# Altium schematic sheet JESD204_B_or_C.SchDoc: JESD204_B
size A3; Organization: Altium Limited; Address1: L3, 12a Rodborough Rd; Address2: Frenchs Forest; Address3: NSW; Address4: Australia 2086
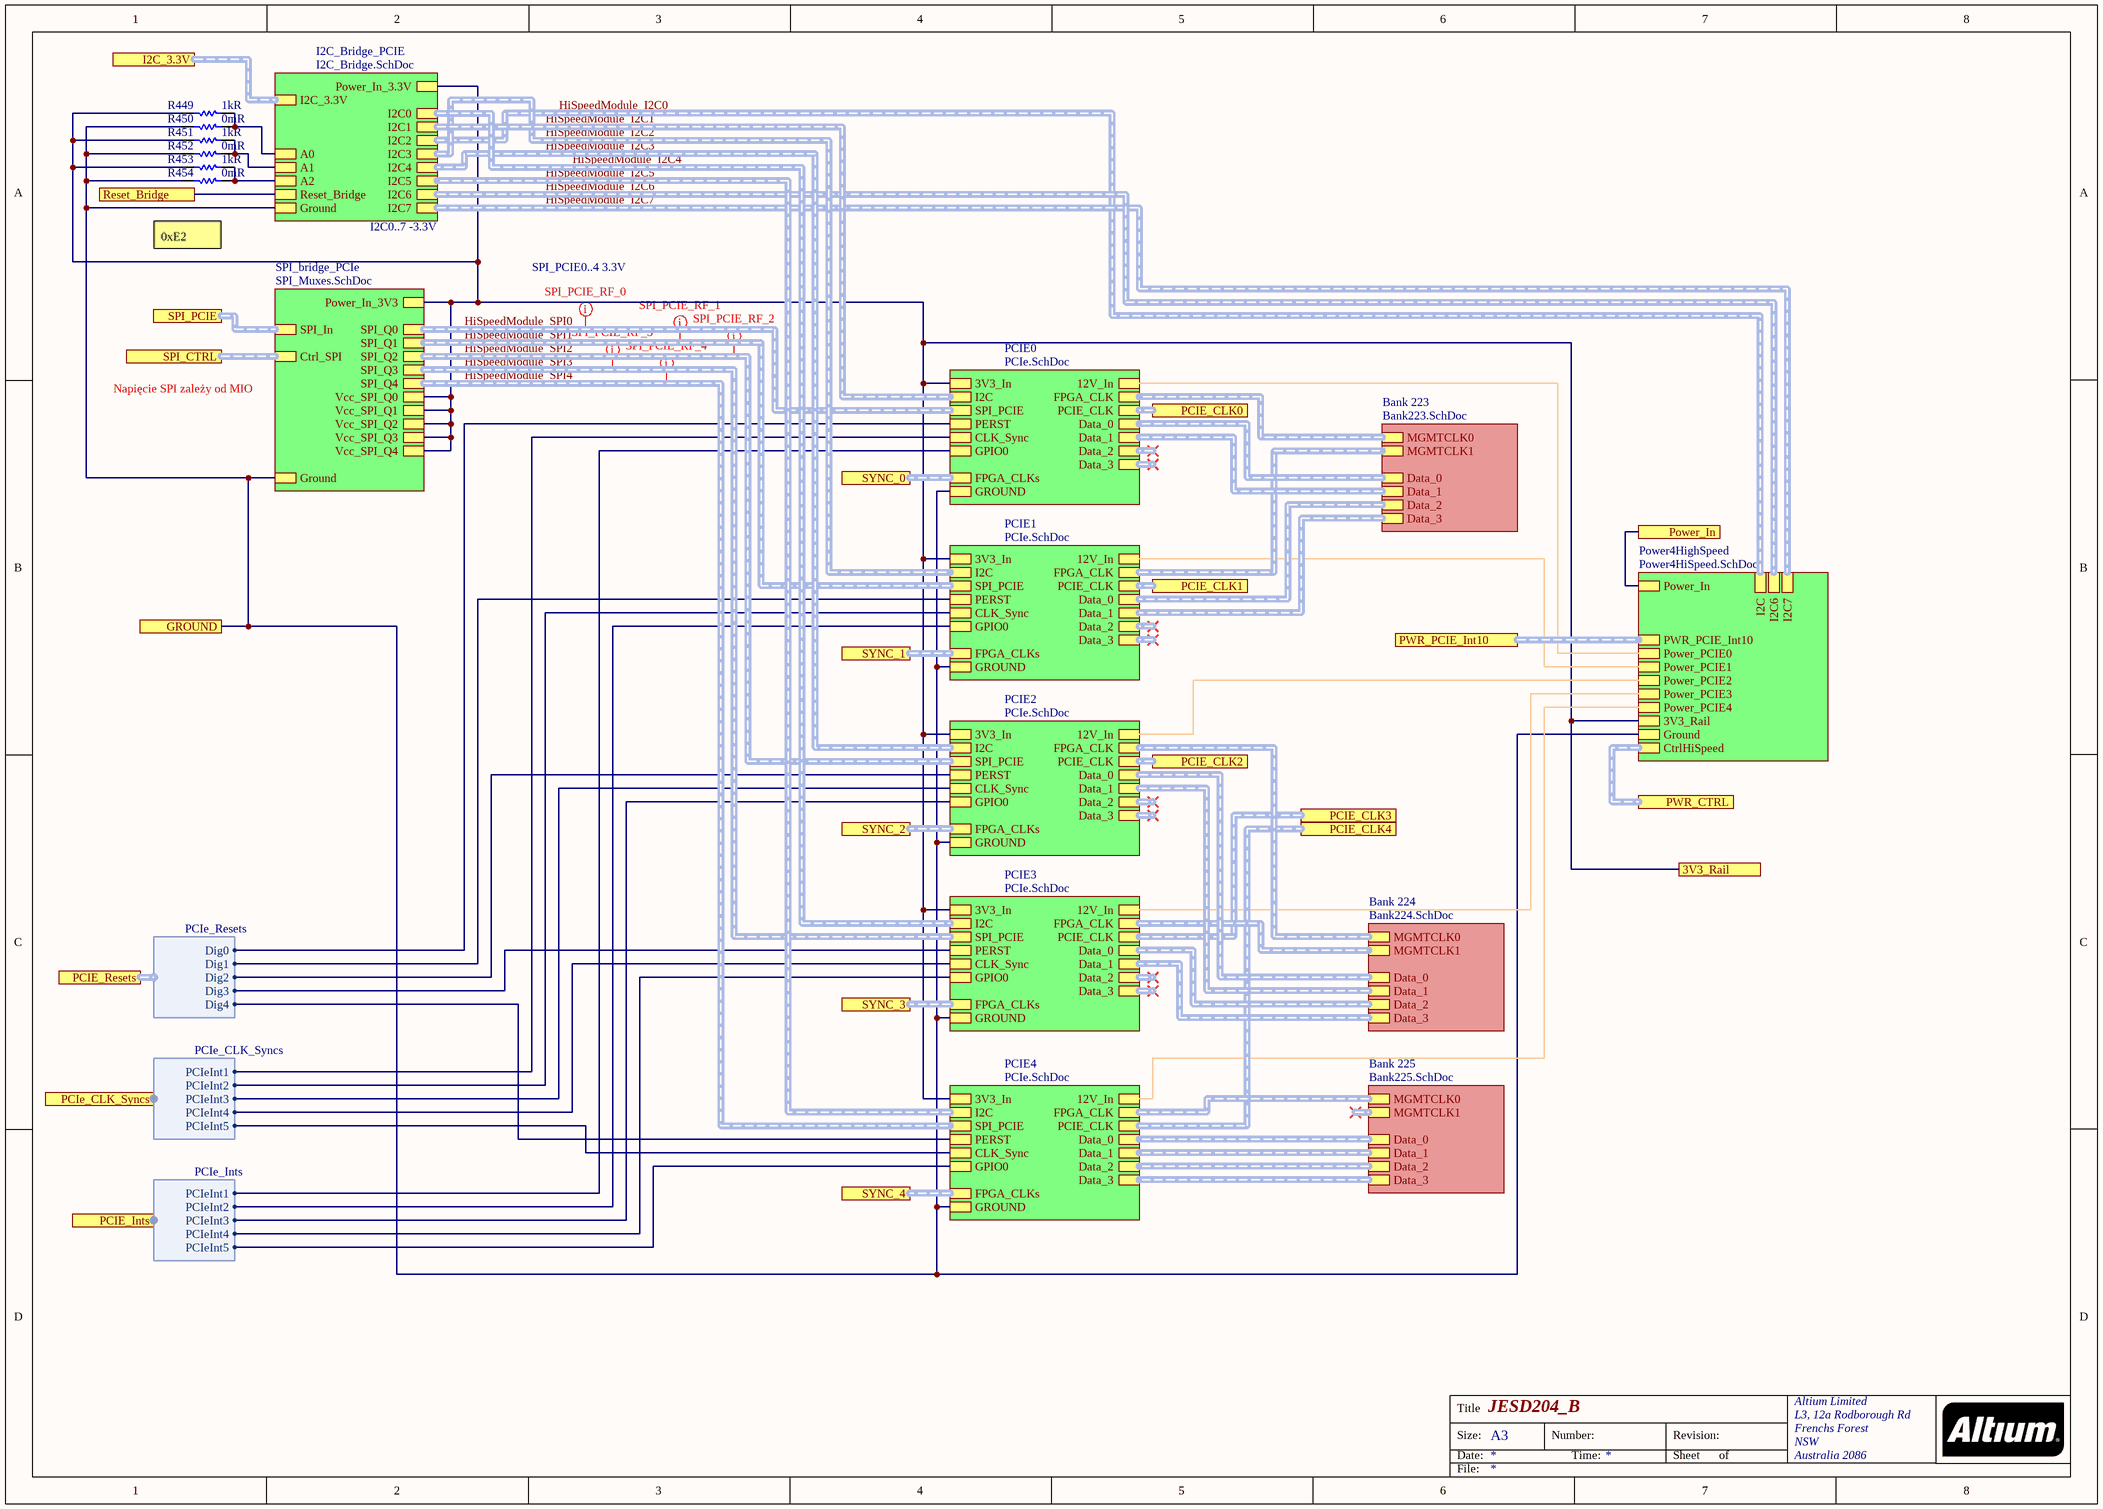
[diagram p0: JESD204_B_or_C.SchDoc]

## Parts
R449  1kR  [RES 0402/1005 RF KK]
R450  0mR  [RES 0402/1005 RF KK]
R451  1kR  [RES 0402/1005 RF KK]
R452  0mR  [RES 0402/1005 RF KK]
R453  1kR  [RES 0402/1005 RF KK]
R454  0mR  [RES 0402/1005 RF KK]

## Sub-sheets
Bank 223 = Bank223.SchDoc: MGMTCLK0 (harness Diff_1Pair), MGMTCLK1 (harness Diff_1Pair), Data_3 (harness Diff_2PairData), Data_2 (harness Diff_2PairData), Data_1 (harness Diff_2PairData), Data_0 (harness Diff_2PairData)
Bank 224 = Bank224.SchDoc: MGMTCLK0 (harness Diff_1Pair), MGMTCLK1 (harness Diff_1Pair), Data_3 (harness Diff_2PairData), Data_2 (harness Diff_2PairData), Data_1 (harness Diff_2PairData), Data_0 (harness Diff_2PairData)
Bank 225 = Bank225.SchDoc: Data_3 (harness Diff_2PairData), MGMTCLK0 (harness Diff_1Pair), Data_2 (harness Diff_2PairData), Data_1 (harness Diff_2PairData), Data_0 (harness Diff_2PairData), MGMTCLK1 (harness Diff_1Pair)
I2C_Bridge_PCIE = I2C_Bridge.SchDoc: I2C0 (harness I2C), I2C1 (harness I2C), I2C2 (harness I2C), I2C3 (harness I2C), I2C4 (harness I2C), I2C5 (harness I2C), I2C6 (harness I2C), I2C7 (harness I2C), Ground, A2, A1, A0, I2C_3.3V (harness I2C), Reset_Bridge, Power_In_3.3V
PCIE0 = PCIe.SchDoc: 12V_In, I2C (harness I2C), PERST, Data_0 (harness Diff_2PairData), Data_1 (harness Diff_2PairData), Data_2 (harness Diff_2PairData), Data_3 (harness Diff_2PairData), SPI_PCIE (harness SPI_H), 3V3_In, GROUND, FPGA_CLKs (harness Diff_3Diff_Pcie), PCIE_CLK (harness Diff_1Pair), CLK_Sync, GPIO0, FPGA_CLK (harness Diff_1Pair)
PCIE1 = PCIe.SchDoc: 12V_In, I2C (harness I2C), PCIE_CLK (harness Diff_1Pair), PERST, Data_0 (harness Diff_2PairData), Data_1 (harness Diff_2PairData), Data_2 (harness Diff_2PairData), Data_3 (harness Diff_2PairData), SPI_PCIE (harness SPI_H), 3V3_In, GROUND, FPGA_CLKs (harness Diff_3Diff_Pcie), CLK_Sync, GPIO0, FPGA_CLK (harness Diff_1Pair)
PCIE2 = PCIe.SchDoc: 12V_In, I2C (harness I2C), PCIE_CLK (harness Diff_1Pair), PERST, Data_0 (harness Diff_2PairData), Data_1 (harness Diff_2PairData), Data_2 (harness Diff_2PairData), Data_3 (harness Diff_2PairData), SPI_PCIE (harness SPI_H), 3V3_In, GROUND, FPGA_CLKs (harness Diff_3Diff_Pcie), CLK_Sync, GPIO0, FPGA_CLK (harness Diff_1Pair)
PCIE3 = PCIe.SchDoc: 12V_In, I2C (harness I2C), PCIE_CLK (harness Diff_1Pair), PERST, Data_0 (harness Diff_2PairData), Data_1 (harness Diff_2PairData), Data_2 (harness Diff_2PairData), Data_3 (harness Diff_2PairData), SPI_PCIE (harness SPI_H), 3V3_In, GROUND, FPGA_CLKs (harness Diff_3Diff_Pcie), CLK_Sync, GPIO0, FPGA_CLK (harness Diff_1Pair)
PCIE4 = PCIe.SchDoc: 12V_In, I2C (harness I2C), PCIE_CLK (harness Diff_1Pair), PERST, Data_0 (harness Diff_2PairData), Data_1 (harness Diff_2PairData), Data_2 (harness Diff_2PairData), Data_3 (harness Diff_2PairData), SPI_PCIE (harness SPI_H), 3V3_In, FPGA_CLKs (harness Diff_3Diff_Pcie), GROUND, CLK_Sync, GPIO0, FPGA_CLK (harness Diff_1Pair)
Power4HighSpeed = Power4HiSpeed.SchDoc: Power_In, Power_PCIE0, Power_PCIE1, Power_PCIE2, Power_PCIE3, Power_PCIE4, CtrlHiSpeed (harness Ctrl_Pwr4HiSpeed), Ground, I2C (harness I2C), 3V3_Rail, PWR_PCIE_Int10 (harness PWR_PCIE_Int10), I2C6, I2C7
SPI_bridge_PCIe = SPI_Muxes.SchDoc: SPI_Q0 (harness SPI_H), SPI_Q1 (harness SPI_H), SPI_Q2 (harness SPI_H), SPI_Q3 (harness SPI_H), SPI_Q4 (harness SPI_H), SPI_In (harness SPI_H), Power_In_3V3, Ctrl_SPI (harness Ctrl_SPI_PCIE), Vcc_SPI_Q4, Vcc_SPI_Q3, Vcc_SPI_Q2, Vcc_SPI_Q1, Vcc_SPI_Q0, Ground

## Ports
3V3_Rail, GROUND, I2C_3.3V (harness I2C), PCIE_CLK0 (harness Diff_1Pair), PCIE_CLK1 (harness Diff_1Pair), PCIE_CLK2 (harness Diff_1Pair), PCIE_CLK3 (harness Diff_1Pair), PCIE_CLK4 (harness Diff_1Pair), PCIe_CLK_Syncs (harness PCIe_CLK_Syncs), PCIE_Ints (harness PCIe_Ints), PCIE_Resets (harness PCIe_Resets), Power_In, PWR_CTRL (harness Ctrl_Pwr4HiSpeed), PWR_PCIE_Int10 (harness PWR_PCIE_Int10), Reset_Bridge, SPI_CTRL (harness Ctrl_SPI_PCIE), SPI_PCIE (harness SPI_H), SYNC_0 (harness Diff_3Diff_Pcie), SYNC_1 (harness Diff_3Diff_Pcie), SYNC_2 (harness Diff_3Diff_Pcie), SYNC_3 (harness Diff_3Diff_Pcie), SYNC_4 (harness Diff_3Diff_Pcie)

## Harnesses
PCIe_Resets: Dig0, Dig1, Dig2, Dig3, Dig4
PCIe_CLK_Syncs: PCIeInt1, PCIeInt2, PCIeInt3, PCIeInt4, PCIeInt5
PCIe_Ints: PCIeInt1, PCIeInt2, PCIeInt3, PCIeInt4, PCIeInt5

## Nets
3V3_Rail: R449.1 R451.1 R453.1 ; port 3V3_Rail, sheet PCIE0/3V3_In, sheet PCIE1/3V3_In, sheet PCIE2/3V3_In, sheet PCIE3/3V3_In, sheet PCIE4/3V3_In, sheet I2C_Bridge_PCIE/Power_In_3.3V, sheet SPI_bridge_PCIe/Power_In_3V3, sheet SPI_bridge_PCIe/Vcc_SPI_Q4, sheet SPI_bridge_PCIe/Vcc_SPI_Q3, sheet SPI_bridge_PCIe/Vcc_SPI_Q2, sheet SPI_bridge_PCIe/Vcc_SPI_Q1, sheet SPI_bridge_PCIe/Vcc_SPI_Q0, sheet Power4HighSpeed/3V3_Rail
GROUND: R450.2 R452.2 R454.2 ; port GROUND, sheet PCIE0/GROUND, sheet PCIE1/GROUND, sheet PCIE2/GROUND, sheet PCIE3/GROUND, sheet PCIE4/GROUND, sheet I2C_Bridge_PCIE/Ground, sheet SPI_bridge_PCIe/Ground, sheet Power4HighSpeed/Ground
Power_In: port Power_In, sheet Power4HighSpeed/Power_In
Reset_Bridge: port Reset_Bridge, sheet I2C_Bridge_PCIE/Reset_Bridge
NetR449_2: R449.2 R450.1 ; sheet I2C_Bridge_PCIE/A0
NetR451_2: R451.2 R452.1 ; sheet I2C_Bridge_PCIE/A1
NetR453_2: R453.2 R454.1 ; sheet I2C_Bridge_PCIE/A2
(unnamed): sheet PCIE0/12V_In, sheet Power4HighSpeed/Power_PCIE0
(unnamed): sheet PCIE0/PERST, port PCIE_Resets.Dig0
(unnamed): sheet PCIE0/CLK_Sync, port PCIe_CLK_Syncs.PCIeInt1
(unnamed): sheet PCIE0/GPIO0, port PCIE_Ints.PCIeInt1
(unnamed): sheet PCIE1/12V_In, sheet Power4HighSpeed/Power_PCIE1
(unnamed): sheet PCIE1/PERST, port PCIE_Resets.Dig1
(unnamed): sheet PCIE1/CLK_Sync, port PCIe_CLK_Syncs.PCIeInt2
(unnamed): sheet PCIE1/GPIO0, port PCIE_Ints.PCIeInt2
(unnamed): sheet PCIE2/12V_In, sheet Power4HighSpeed/Power_PCIE2
(unnamed): sheet PCIE2/PERST, port PCIE_Resets.Dig2
(unnamed): sheet PCIE2/CLK_Sync, port PCIe_CLK_Syncs.PCIeInt3
(unnamed): sheet PCIE2/GPIO0, port PCIE_Ints.PCIeInt3
(unnamed): sheet PCIE3/12V_In, sheet Power4HighSpeed/Power_PCIE3
(unnamed): sheet PCIE3/PERST, port PCIE_Resets.Dig3
(unnamed): sheet PCIE3/CLK_Sync, port PCIe_CLK_Syncs.PCIeInt4
(unnamed): sheet PCIE3/GPIO0, port PCIE_Ints.PCIeInt4
(unnamed): sheet PCIE4/12V_In, sheet Power4HighSpeed/Power_PCIE4
(unnamed): sheet PCIE4/PERST, port PCIE_Resets.Dig4
(unnamed): sheet PCIE4/CLK_Sync, port PCIe_CLK_Syncs.PCIeInt5
(unnamed): sheet PCIE4/GPIO0, port PCIE_Ints.PCIeInt5

## Buses and harness runs
harness HiSpeedModule_I2C0 = sheet I2C_Bridge_PCIE/I2C2 = sheet Power4HighSpeed/I2C
harness HiSpeedModule_I2C1 = sheet I2C_Bridge_PCIE/I2C1 = sheet PCIE0/I2C
harness HiSpeedModule_I2C2 = sheet I2C_Bridge_PCIE/I2C3 = sheet PCIE1/I2C
harness HiSpeedModule_I2C3 = sheet I2C_Bridge_PCIE/I2C4 = sheet PCIE2/I2C
harness HiSpeedModule_I2C4 = sheet I2C_Bridge_PCIE/I2C0 = sheet PCIE3/I2C
harness HiSpeedModule_I2C5 = sheet I2C_Bridge_PCIE/I2C5 = sheet PCIE4/I2C
harness HiSpeedModule_I2C6 = sheet I2C_Bridge_PCIE/I2C6 = sheet Power4HighSpeed/I2C6
harness HiSpeedModule_I2C7 = sheet I2C_Bridge_PCIE/I2C7 = sheet Power4HighSpeed/I2C7
harness HiSpeedModule_SPI0 = sheet PCIE0/SPI_PCIE = sheet SPI_bridge_PCIe/SPI_Q0
harness HiSpeedModule_SPI1 = sheet PCIE1/SPI_PCIE = sheet SPI_bridge_PCIe/SPI_Q1
harness HiSpeedModule_SPI2 = sheet PCIE2/SPI_PCIE = sheet SPI_bridge_PCIe/SPI_Q2
harness HiSpeedModule_SPI3 = sheet PCIE3/SPI_PCIE = sheet SPI_bridge_PCIe/SPI_Q3
harness HiSpeedModule_SPI4 = sheet PCIE4/SPI_PCIE = sheet SPI_bridge_PCIe/SPI_Q4
harness port I2C_3.3V = sheet I2C_Bridge_PCIE/I2C_3.3V
harness port PCIE_CLK0 = sheet PCIE0/PCIE_CLK
harness port PCIE_CLK1 = sheet PCIE1/PCIE_CLK
harness port PCIE_CLK2 = sheet PCIE2/PCIE_CLK
harness port PCIE_CLK3 = sheet PCIE3/PCIE_CLK
harness port PCIE_CLK4 = sheet PCIE4/PCIE_CLK
harness port PWR_CTRL = sheet Power4HighSpeed/CtrlHiSpeed
harness port PWR_PCIE_Int10 = sheet Power4HighSpeed/PWR_PCIE_Int10
harness port SPI_CTRL = sheet SPI_bridge_PCIe/Ctrl_SPI
harness port SPI_PCIE = sheet SPI_bridge_PCIe/SPI_In
harness port SYNC_0 = sheet PCIE0/FPGA_CLKs
harness port SYNC_1 = sheet PCIE1/FPGA_CLKs
harness port SYNC_2 = sheet PCIE2/FPGA_CLKs
harness port SYNC_3 = sheet PCIE3/FPGA_CLKs
harness port SYNC_4 = sheet PCIE4/FPGA_CLKs
harness sheet Bank 223/Data_0 = sheet PCIE0/Data_0
harness sheet Bank 223/Data_1 = sheet PCIE0/Data_1
harness sheet Bank 223/Data_2 = sheet PCIE1/Data_0
harness sheet Bank 223/Data_3 = sheet PCIE1/Data_1
harness sheet Bank 223/MGMTCLK0 = sheet PCIE0/FPGA_CLK
harness sheet Bank 223/MGMTCLK1 = sheet PCIE1/FPGA_CLK
harness sheet Bank 224/Data_0 = sheet PCIE2/Data_0
harness sheet Bank 224/Data_1 = sheet PCIE2/Data_1
harness sheet Bank 224/Data_2 = sheet PCIE3/Data_0
harness sheet Bank 224/Data_3 = sheet PCIE3/Data_1
harness sheet Bank 224/MGMTCLK0 = sheet PCIE2/FPGA_CLK
harness sheet Bank 224/MGMTCLK1 = sheet PCIE3/FPGA_CLK
harness sheet Bank 225/Data_0 = sheet PCIE4/Data_0
harness sheet Bank 225/Data_1 = sheet PCIE4/Data_1
harness sheet Bank 225/Data_2 = sheet PCIE4/Data_2
harness sheet Bank 225/Data_3 = sheet PCIE4/Data_3
harness sheet Bank 225/MGMTCLK0 = sheet PCIE4/FPGA_CLK

## Layout directives
net class SPI_PCIE_RF_0: (no net found under the mark)
net class SPI_PCIE_RF_1: (no net found under the mark)
net class SPI_PCIE_RF_2: (no net found under the mark)
net class SPI_PCIE_RF_3: (no net found under the mark)
net class SPI_PCIE_RF_4: (no net found under the mark)

## Notes on the sheet
- 0xE2
- I2C0..7 -3.3V
- SPI_PCIE0..4 3.3V
- Napięcie SPI zależy od MIO
- Title
- Size:
- Date:
- A3
- Number:
- Time:
- Revision:
- Sheet
- of
- File:

## Library data of the parts
R449 R451 R453 = Resistor: PANASONIC - ERJ-2RKF1001X - SMD Chip Resistor, 0402 [1005 Metric], 1 kohm, ERJ2R Series, 50 V, Thick Film, 100 mW; Temperature Coefficient: 100ppm/°C; Tolerance: 1%; Voltage Rating (DC): 50V; Power Rating: 100mW; Supplier 1: Digi-Key; Supplier Part Number 1: P1.00KLDKR-ND; Manufacturer: Panasonic; Manufacturer Part Number: ERJ-2RKF1001X; RoHS: Yes; Category: Chip SMD Resistors; Stock 1: 1864188; Pricing 1: 1=0,10000, 10=0,04300, 100=0,01740, 1000=0,00782, 2500=0,00678, 5000=0,00561 (USD); Mount: Surface Mount; Case/Package: 0402; Number of Pins: 2; Contact Plating: Tin; Case Code (Imperial): 0402; Case Code (Metric): 1005; Min Operating Temperature: -55°C; Max Operating Temperature: 155°C; Composition: Thick Film; Resistance: 1kR; Termination: SMD/SMT; Number of Terminations: 2; Military Standard: Not; Features: Automotive AEC-Q200; Packaging: Tape and Reel; Voltage Rating: 50V; Package Quantity: 1; Max Power Dissipation: 100mW; Working Voltage: 50V; Length: 1mm; Height: 0.35mm; Depth: 0.5mm; Width: 0.5mm; Radiation Hardening: No; Lead Free: Lead Free; REACH SVHC: No SVHC; ComponentLink1URL: https://datasheet.ciiva.com/11821/0900766b80f80784-11821203.pdf?src-supplier=RSComponents; ComponentLink1Description: https://datasheet.ciiva.com/11821/0900766b80f80784-11821203.pdf?src-supplier=RSComponents; ComponentLink2URL: https://datasheet.ciiva.com/7942/aoa0000ce2-7942426.pdf?src-supplier=Element14; ComponentLink2Description: https://datasheet.ciiva.com/7942/aoa0000ce2-7942426.pdf?src-supplier=Element14; ComponentLink3URL: https://datasheet.ciiva.com/16523/aoa0000ce2-16523834.pdf?src-supplier=Avnet+Asia; ComponentLink3Description: https://datasheet.ciiva.com/16523/aoa0000ce2-16523834.pdf?src-supplier=Avnet+Asia; ComponentLink4URL: https://datasheet.ciiva.com/17215/aoa0000ce2-17215308.pdf?src-supplier=Avnet+Europe; ComponentLink4Description: https://datasheet.ciiva.com/17215/aoa0000ce2-17215308.pdf?src-supplier=Avnet+Europe; ComponentLink5URL: https://datasheet.ciiva.com/22673/1678782-22673916.pdf?src-supplier=Element14; ComponentLink5Description: https://datasheet.ciiva.com/22673/1678782-22673916.pdf?src-supplier=Element14; ComponentLink6URL: https://datasheet.ciiva.com/28532/1678782-28532109.pdf?src-supplier=Element14; ComponentLink6Description: https://datasheet.ciiva.com/28532/1678782-28532109.pdf?src-supplier=Element14; ComponentLink7URL: https://datasheet.ciiva.com/16767/70260748-16767559.pdf?src-supplier=Allied+Electronics; ComponentLink7Description: https://datasheet.ciiva.com/16767/70260748-16767559.pdf?src-supplier=Allied+Electronics; ComponentLink8URL: https://datasheet.ciiva.com/9198/aoa0000ce2-9198920.pdf?src-supplier=Avnet; ComponentLink8Description: https://datasheet.ciiva.com/9198/aoa0000ce2-9198920.pdf?src-supplier=Avnet; ComponentLink9URL: https://datasheet.ciiva.com/16771/70260748-16771979.pdf?src-supplier=Allied+Electronics; ComponentLink9Description: https://datasheet.ciiva.com/16771/70260748-16771979.pdf?src-supplier=Allied+Electronics
R450 R452 R454 = Resistor: Manufacturer 1: Yageo; Manufacturer Part Number 1: RC0402JR-070RL; Power Rating: 62.5mW; Tolerance: 5%; Voltage Rating: 50V; Max Power Dissipation: 63mW; Temperature Coefficient: 200ppm/°C; Supplier 1: Digi-Key; Supplier Part Number 1: 311-0.0JRCT-ND; Stock 1: 69822252; Pricing 1: 1=0.10000, 10=0.01200, 25=0.00920, 50=0.00680, 100=0.00510, 250=0.00388, 500=0.00308, 1000=0.00227, 5000=0.00163 (USD); RoHS: Yes; Case/Package: 0402; Contact Plating: Tin,Matte; Case Code (Metric): 1005; Case Code (Imperial): 0402; Min Operating Temperature: -55°C; Max Operating Temperature: 155°C; Resistance: 0mR; Packaging: Tape and Reel; Composition: Thick Film; Package Quantity: 1; Number of Terminations: 2; Termination: SMD/SMT; Military Standard: Not; Features: Moisture Resistant; Length: 1mm; Height: 0.016inch; Width: 0.02inch; Depth: 0.5mm; Radiation Hardening: No; REACH SVHC: Unknown; Lead Free: Lead Free; ComponentLink1URL: https://datasheet.ciiva.com/2452/pyu-rc0402-51-rohs-l-6-2452608.pdf?src-supplier=Digi-Key; ComponentLink1Description: https://datasheet.ciiva.com/2452/pyu-rc0402-51-rohs-l-6-2452608.pdf?src-supplier=Digi-Key; ComponentLink2URL: https://datasheet.ciiva.com/11808/0900766b80c66297-11808195.pdf?src-supplier=RSComponents; ComponentLink2Description: https://datasheet.ciiva.com/11808/0900766b80c66297-11808195.pdf?src-supplier=RSComponents; ComponentLink3URL: https://datasheet.ciiva.com/2452/pyu-r-int-thick-7-2452609.pdf?src-supplier=Digi-Key; ComponentLink3Description: https://datasheet.ciiva.com/2452/pyu-r-int-thick-7-2452609.pdf?src-supplier=Digi-Key; ComponentLink4URL: https://datasheet.ciiva.com/22747/1018594-22747515.pdf?src-supplier=Element14; ComponentLink4Description: https://datasheet.ciiva.com/22747/1018594-22747515.pdf?src-supplier=Element14; ComponentLink5URL: https://datasheet.ciiva.com/7983/1018594-7983535.pdf?src-supplier=Element14; ComponentLink5Description: https://datasheet.ciiva.com/7983/1018594-7983535.pdf?src-supplier=Element14; ComponentLink6URL: https://datasheet.ciiva.com/2452/pyu-r-int-thick-7-2452610.pdf?src-supplier=Digi-Key; ComponentLink6Description: https://datasheet.ciiva.com/2452/pyu-r-int-thick-7-2452610.pdf?src-supplier=Digi-Key; ComponentLink7URL: https://datasheet.ciiva.com/8896/pyu-rc0402-51-rohs-l-6-8896201.pdf?src-supplier=Avnet; ComponentLink7Description: https://datasheet.ciiva.com/8896/pyu-rc0402-51-rohs-l-6-8896201.pdf?src-supplier=Avnet; ComponentLink8URL: https://datasheet.ciiva.com/28386/pyu-rc0402-51-rohs-l-6-28386633.pdf?src-supplier=Avnet+Europe; ComponentLink8Description: https://datasheet.ciiva.com/28386/pyu-rc0402-51-rohs-l-6-28386633.pdf?src-supplier=Avnet+Europe; ComponentLink9URL: https://datasheet.ciiva.com/15189/getdatasheetpartid-326379-15189533.pdf?src-supplier=Verical; ComponentLink9Description: https://datasheet.ciiva.com/15189/getdatasheetpartid-326379-15189533.pdf?src-supplier=Verical